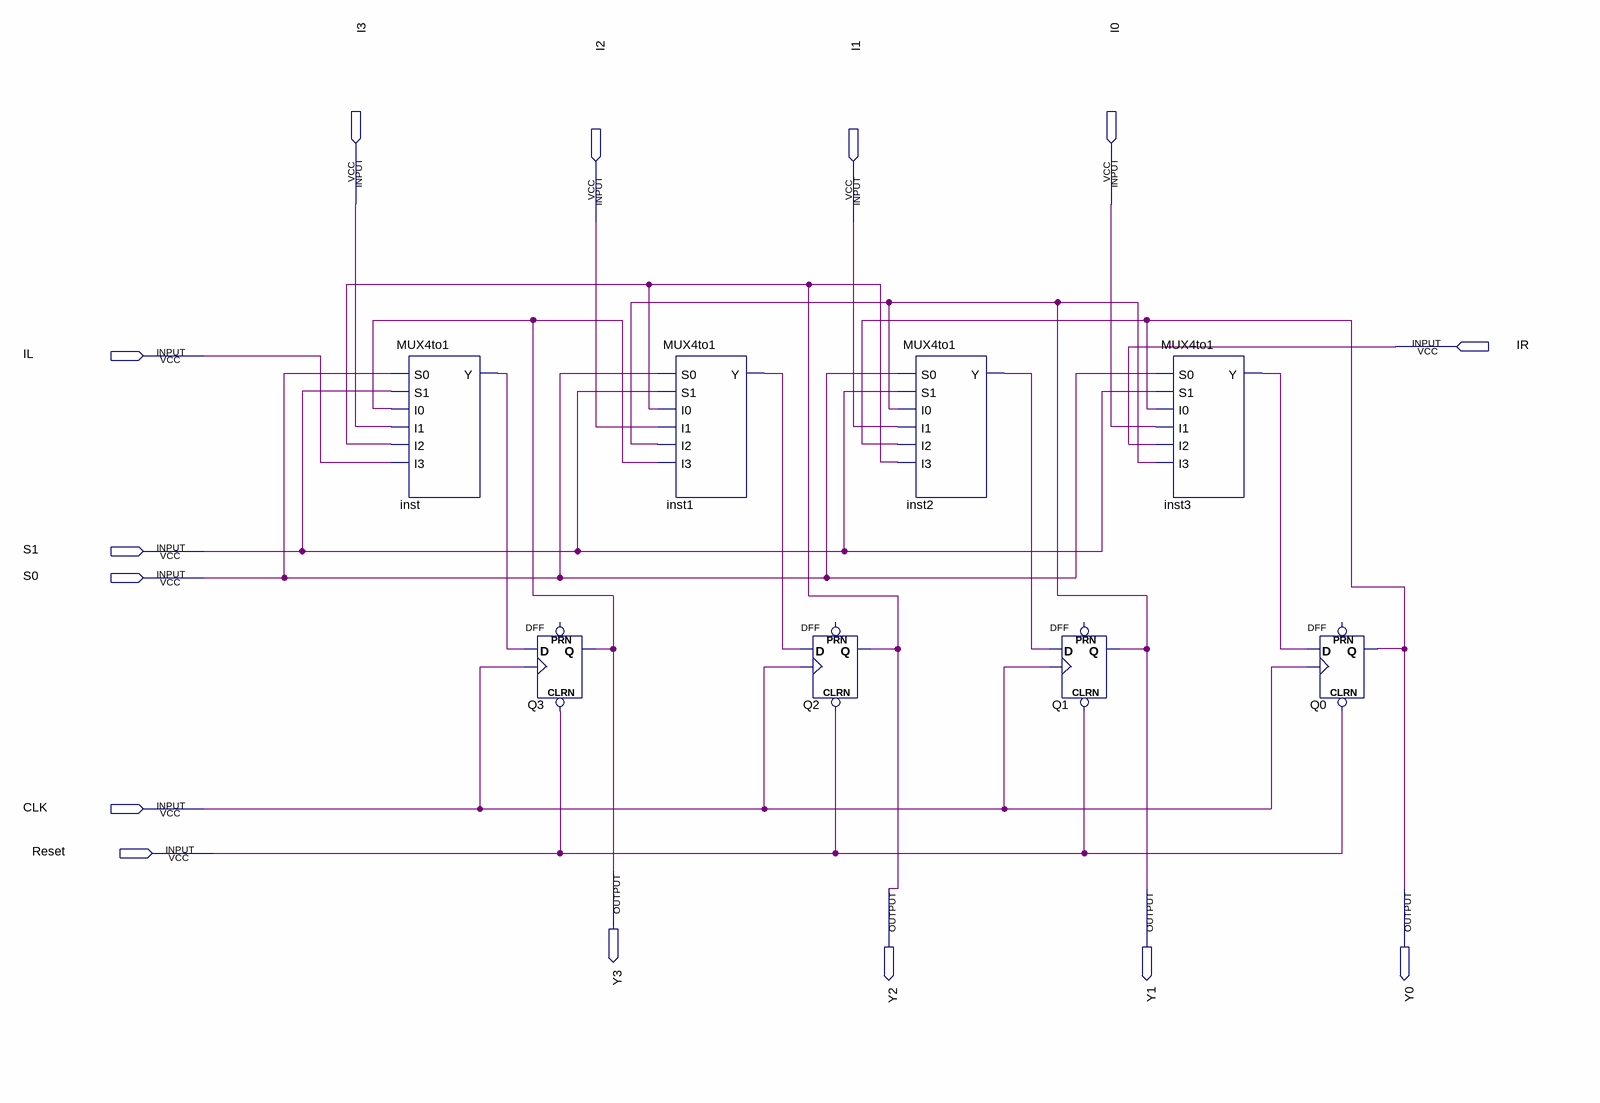
[diagram p0: schematic sheet]
// Quartus schematic shiftregister.bdf as structural Verilog: 8 symbols, 14 pins
module shiftregister (
  input  I3,
  input  I0,
  input  I2,
  input  I1,
  input  IR,
  input  IL,
  input  S1,
  input  S0,
  input  CLK,
  input  Reset,
  output Y3,
  output Y2,
  output Y1,
  output Y0
);

  wire inst1_y, inst2_y, inst3_y, inst_y;

  MUX4to1 inst (.S0(S0), .S1(S1), .I0(Y3), .I1(I3), .I2(Y2), .I3(IL), .Y(inst_y));
  DFF Q3 (.CLRN(Reset), .CLK(CLK), .D(inst_y), .Q(Y3));  // open: PRN
  MUX4to1 inst1 (.S0(S0), .S1(S1), .I0(Y2), .I1(I2), .I2(Y1), .I3(Y3), .Y(inst1_y));
  DFF Q2 (.CLRN(Reset), .CLK(CLK), .D(inst1_y), .Q(Y2));  // open: PRN
  MUX4to1 inst2 (.S0(S0), .S1(S1), .I0(Y1), .I1(I1), .I2(Y0), .I3(Y2), .Y(inst2_y));
  DFF Q1 (.CLRN(Reset), .CLK(CLK), .D(inst2_y), .Q(Y1));  // open: PRN
  MUX4to1 inst3 (.S0(S0), .S1(S1), .I0(Y0), .I1(I0), .I2(IR), .I3(Y1), .Y(inst3_y));
  DFF Q0 (.CLRN(Reset), .CLK(CLK), .D(inst3_y), .Q(Y0));  // open: PRN
endmodule
